# Altium schematic sheet Power Regulation.SchDoc
size A4; Engineer: Naif Aljohani; DocumentNumber: 7; Revision: v1.0; SheetNumber: 4; SheetTotal: 7
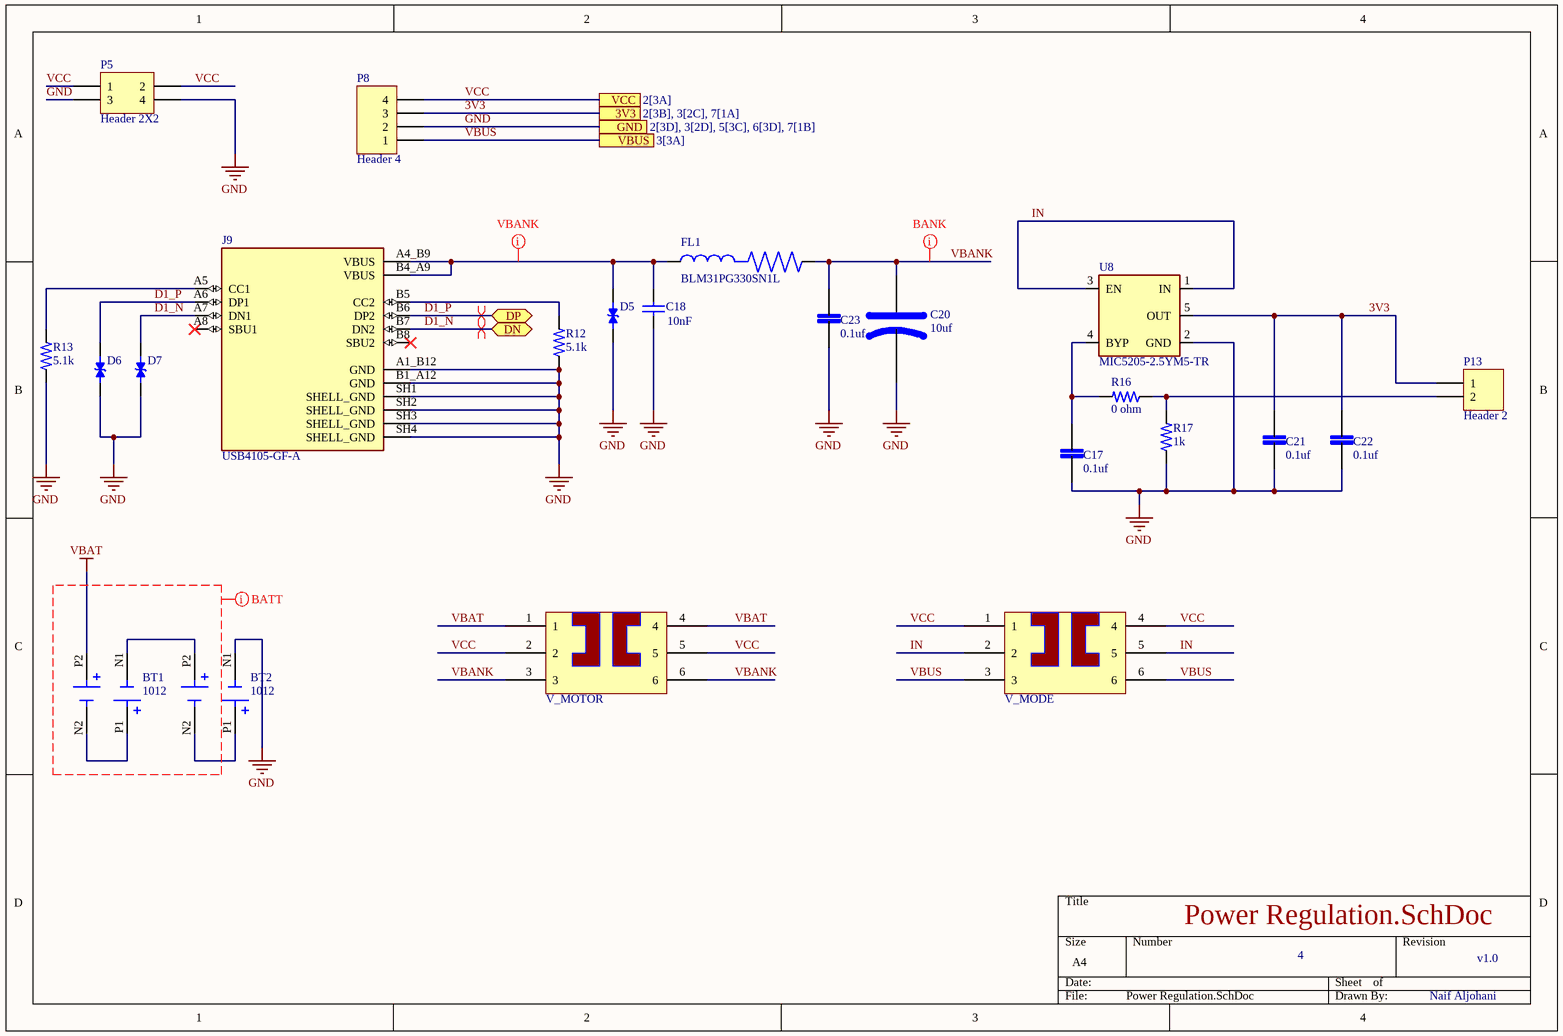
[diagram p0: Power Regulation.SchDoc]

## Parts
BT1  1012  [BAT_1012]
BT2  1012  [BAT_1012]
C17  0.1uf  [CAPC2012X140N]
C18  value 10nF  [C1206]  (hidden comment: Cap Semi)
C20  10uf  [CAPAE660X550N]
C21  0.1uf  [CAPC2012X140N]
C22  0.1uf  [CAPC2012X140N]
C23  0.1uf  [CAPC2012X140N]
D5  LESD5D5.0CT1G  [TVS_LESD5D5.0CT1G]  (value not drawn)
D6  LESD5D5.0CT1G  [TVS_LESD5D5.0CT1G]  (value not drawn)
D7  LESD5D5.0CT1G  [TVS_LESD5D5.0CT1G]  (value not drawn)
FL1  BLM31PG330SN1L  [BEADC3216X130N]
J9  USB4105-GF-A  [GCT_USB4105-GF-A]
P5  Header 2X2  [HDR2X2]
P8  Header 4  [HDR1X4]
P13  Header 2  [HDR1X2]
R12  5.1k  [RESC3115X65N]
R13  5.1k  [RESC3115X65N]
R16  0 ohm  [RESC3115X65N]
R17  1k  [RESC3115X65N]
U8  MIC5205-2.5YM5-TR  [SOT95P280X145-5N]
V_MODE  MS-22C01-G010  [G Switch]  (value not drawn)
V_MOTOR  MS-22C01-G010  [G Switch]  (value not drawn)

## Ports
3V3 (see 2[3B], 3[2C], 7[1A]), DN (bidir), DP (bidir), GND (see 2[3D], 3[2D], 5[3C], 6[3D], 7[1B]), VBUS (see 3[3A]), VCC (see 2[3A])

## Nets
GND: BT2.N1(NEG1) C17.1 C18.1 C20.N C21.1 C22.1 C23.1 D5.1 D6.1 D7.1 J9.A1_B12(GND) J9.B1_A12(GND) J9.SH1(SHELL_GND) J9.SH2(SHELL_GND) J9.SH3(SHELL_GND) J9.SH4(SHELL_GND) P5.3 P5.4 P8.2 R12.1 R13.1 R17.1 U8.2(GND) ; port GND
VBAT: BT1.P2(POS2) V_MOTOR.1 V_MOTOR.4
3V3: C21.2 C22.2 P8.3 P13.1 U8.5(OUT) ; port 3V3
D1_N: D7.2 J9.A7(DN1) J9.B7(DN2) ; port DN
D1_P: D6.2 J9.A6(DP1) J9.B6(DP2) ; port DP
IN: U8.1(IN) U8.3(EN) V_MODE.2 V_MODE.5
VBANK: C20.P C23.2 FL1.2 V_MOTOR.3 V_MOTOR.6
VBUS: P8.1 V_MODE.3 V_MODE.6 ; port VBUS
VCC: P5.1 P5.2 P8.4 V_MODE.1 V_MODE.4 V_MOTOR.2 V_MOTOR.5 ; port VCC
NetBT1_N1: BT1.N1(NEG1) BT2.P2(POS2)
NetBT1_N2: BT1.N2(NEG2) BT1.P1(POS1)
NetBT2_N2: BT2.N2(NEG2) BT2.P1(POS1)
NetC17_2: C17.2 R16.2 U8.4(BYP)
NetC18_2: C18.2 D5.2 FL1.1 J9.A4_B9(VBUS) J9.B4_A9(VBUS)
NetJ9_A5: J9.A5(CC1) R13.2
NetJ9_B5: J9.B5(CC2) R12.2
NetP13_2: P13.2 R16.1 R17.2

Not connected (* = marked no-connect by the designer): J9 A8(SBU1)* B8(SBU2)*

## Layout directives
differential pair: D1_N, D1_P
rule Width Constraint [Pref Width = 0.5mm    Min Width = 0.254mm    Max Width = 1mm]: (no net found under the mark)
rule Width Constraint [Pref Width = 0.5mm    Min Width = 0.3mm    Max Width = 1mm]: VBANK
rule Width Constraint [Pref Width = 0.254mm    Min Width = 0.254mm    Max Width = 0.5mm]: NetC18_2

## Library data of the parts
C17 C21-C23 = LD051A121KAB2A: 120PF 100V 10% 0805; MF: {'manufacturer': u'AVX'}; Package: None; Price: None; Value: *; MP: LD051A121KAB2A; Availability: Unavailable
C18 = Cap Semi: Capacitor (Semiconductor SIM Model); Published: 8-Jun-2000; LatestRevisionDate: 29-May-2009; LatestRevisionNote: IPC-7351 Footprint Added.; PackageReference: C1206; Publisher: Altium Limited; PackageDescription: Chip Capacitor
C20 = UWX1H100MCL1GB
D5-D7 = LESD5D5.0CT1G: MF: {'manufacturer': u'Leshan Radio Co.'}; Package: None; Price: None; Value: *; MP: LESD5D5.0CT1G; Availability: Unavailable
FL1 = BLM31PG330SN1L: Ferrite Beads Multi-Layer 33Ohm 25% 100MHz 6A 9mOhm DCR 1206 T/R; MF: {'manufacturer': u'Murata Electronics'}; Package: None; Price: None; Value: *; MP: BLM31PG330SN1L; Availability: Unavailable
J9 = USB4105-GF-A: MF: {'manufacturer': u'GCT'}; Package: None; Price: None; Value: *; MP: USB4105-GF-A; Availability: Unavailable
P5 = Header 2X2: Header, 2-Pin, Dual row; LatestRevisionDate: 17-Jul-2002; LatestRevisionNote: Re-released for DXP Platform.; Publisher: Altium Limited
P8 = Header 4: Header, 4-Pin; LatestRevisionDate: 17-Jul-2002; LatestRevisionNote: Re-released for DXP Platform.; Publisher: Altium Limited
P13 = Header 2: Header, 2-Pin; LatestRevisionDate: 17-Jul-2002; LatestRevisionNote: Re-released for DXP Platform.; Publisher: Altium Limited
R12 R13 R16 R17 = 1-1879462-4: RL73H 2B R43 1% 5K RL; MF: {'manufacturer': u'TE Connectivity'}; Package: None; Price: None; Value: *; MP: 1-1879462-4; Availability: Unavailable
U8 = MIC5205-2.5YM5-TR: MIC5205 Series 3 V Fixed Output 150 mA SMT Low-Noise LDO Regulator - SOT-23-5; MF: {'manufacturer': u'Microchip Technology'}; Price: None; MP: MIC5205-2.5YM5-TR; Availability: Unavailable; Value: *; Package: None
V_MODE V_MOTOR = G-Switch: Standing paste 1A DPDT 6V Black 10000 times SMD Slide Switches ROHS
BT1 BT2 = 1012: Value: *; MP: 1012; Price: None; Package: None; Availability: Unavailable